# Altium schematic sheet Power_Module.SchDoc
size A; SheetNumber: 1; SheetTotal: 7
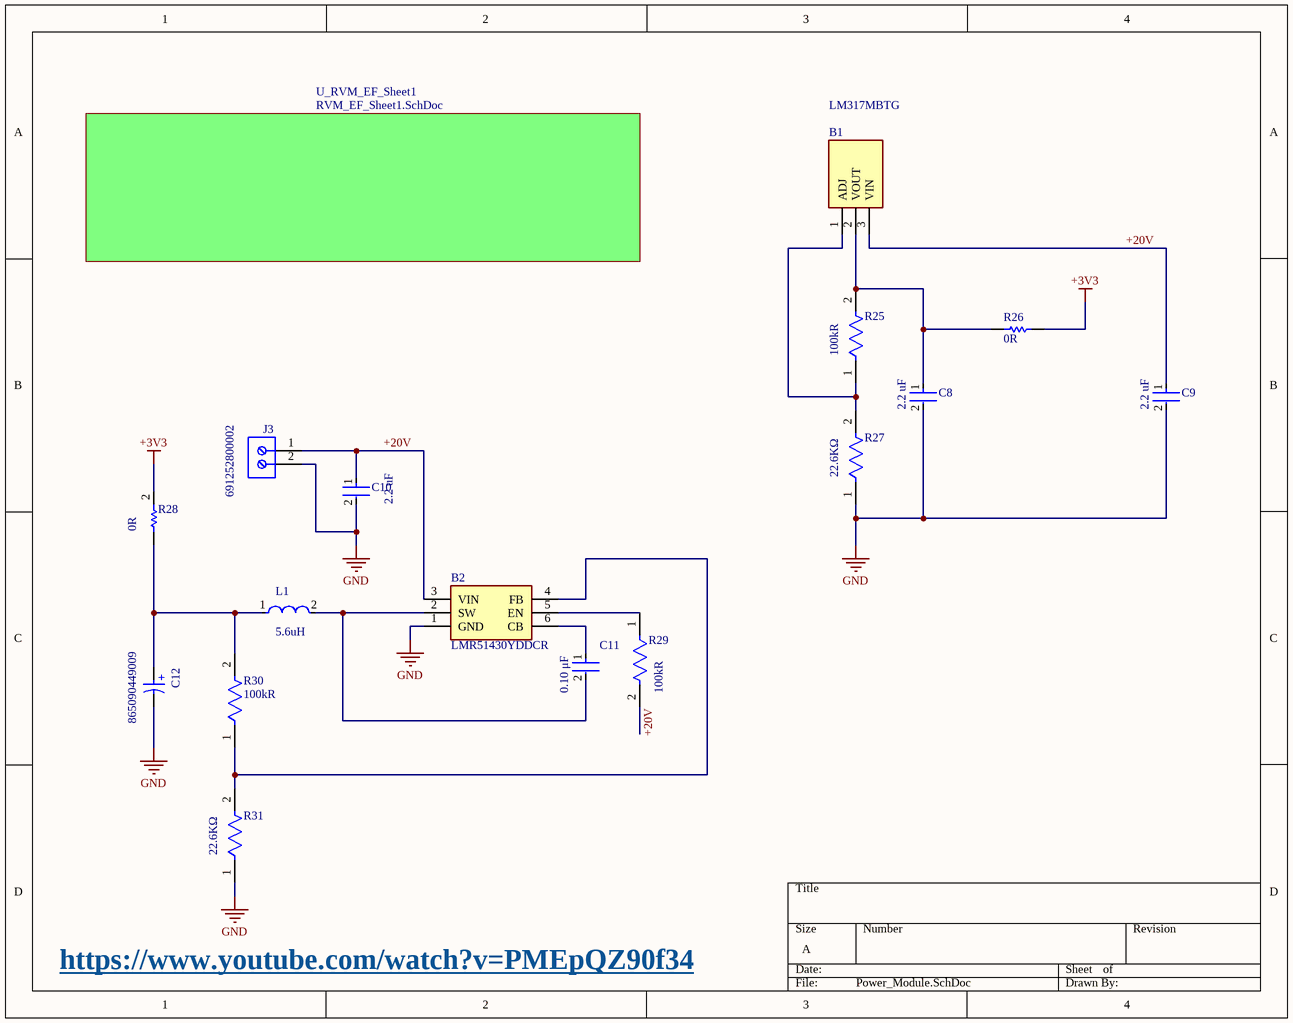
[diagram p0: Power_Module.SchDoc]

## Parts
B1  LM317MBTG  [TO254P482X997X2018-3P]
B2  LMR51430YDDCR  [SOT95P280X110-6N]
C8  value 2.2 uF  [FP-CC0805-0_85-MFG]  (hidden comment: CC0805KKX7R9BB225)
C9  value 2.2 uF  [FP-CC0805-0_85-MFG]  (hidden comment: CC0805KKX7R9BB225)
C10  value 2.2 uF  [FP-CC0805-0_85-MFG]  (hidden comment: CC0805KKX7R9BB225)
C11  value 0.10 μF  [FP-C1206C-EB-MFG]  (hidden comment: C1206C104F3GACTU)
C12  865090449009  [WCAP-ASLU_D8H6.5]
J3  691252800002  [691252800002]
L1  Inductance: 5.6uH  [FP-IHLP-3232CZ-FP_2_413x5-MFG]  (hidden comment: IHLP3232CZER5R6M01)
R25  Resistance: 100kR  [FP-MCU0805-IPC_B]  (hidden comment: MCU08050D1003BP500)
R26  value 0R  [RESC2013X60X35LL10T20]  (hidden comment: RC0805JR-130RL)
R27  value 22.6KΩ  [FP-RT0805-MFG]  (hidden comment: RT0805WRD0722K6L)
R28  value 0R  [RESC2013X60X35LL10T20]  (hidden comment: RC0805JR-130RL)
R29  Resistance: 100kR  [FP-MCU0805-IPC_B]  (hidden comment: MCU08050D1003BP500)
R30  Resistance: 100kR  [FP-MCU0805-IPC_B]  (hidden comment: MCU08050D1003BP500)
R31  value 22.6KΩ  [FP-RT0805-MFG]  (hidden comment: RT0805WRD0722K6L)

## Sub-sheets
U_RVM_EF_Sheet1 = RVM_EF_Sheet1.SchDoc: no entries

## Nets
+3V3: R26.1 R28.2
GND: B2.1(GND) C8.2 C9.2 C10.2 C12.2(N) J3.2 R27.1 R31.1
+20V: B1.3(VIN) B2.3(VIN) C9.1 C10.1 J3.1 R29.2
NetB1_1: B1.1(ADJ) R25.1 R27.2
NetB1_2: B1.2(VOUT) C8.1 R25.2 R26.2
NetB2_2: B2.2(SW) C11.2 L1.2
NetB2_4: B2.4(FB) R30.1 R31.2
NetB2_5: B2.5(EN) R29.1
NetB2_6: B2.6(CB) C11.1
NetC12_1: C12.1(P) L1.1 R28.1 R30.2

## Notes on the sheet
- https://www.youtube.com/watch?v=PMEpQZ90f34
- (in symbol CMP-03913-54202517-2) +

## Library data of the parts
B1 = LM317MBTG: Internal Short Circuit Current Limiting; Internal Thermal Overload Protection; Output Current in Excess of 500 mA; Output Transistor Safe-Area Compensation; Output Adjustable between 1.2 V and 37 V; Floating Operation for High Voltage Applications; Eliminates Stocking Many Fixed Voltages; Pb-Free Packages are Available; NCV Prefix for Automotive and Other Applications Requiring Site Control Changes; Manufacturer_Name: onsemi; Geometry.Height: 4.82mm; Mouser Part Number: 863-LM317MBTG; Mouser Price/Stock: https://www.mouser.co.uk/ProductDetail/onsemi/LM317MBTG?qs=2OtswVQKCOHWWQM%252BNYhxOw%3D%3D; Manufacturer_Part_Number: LM317MBTG; Datasheet Link: https://www.onsemi.com/pub/Collateral/LM317M-D.PDF
B2 = LMR51430YDDCR: Switching Voltage Regulators SIMPLE SWITCHER&reg; 4.5-V to 36-V, 3-A synchronous buck converter with 40-&micro;A IQ; Manufacturer_Name: Texas Instruments; Geometry.Height: 1.1mm; Mouser Part Number: 595-LMR51430YDDCR; Mouser Price/Stock: https://www.mouser.co.uk/ProductDetail/Texas-Instruments/LMR51430YDDCR?qs=vvQtp7zwQdMdLcsY5sFiMg%3D%3D; Manufacturer_Part_Number: LMR51430YDDCR; Datasheet Link: https://www.ti.com/lit/ds/symlink/lmr51430.pdf?ts=1657817980313&ref_url=https%253A%252F%252Fwww.ti.com%252Fproduct%252FLMR51430%253FkeyMatch%253DLMR51430%2526tisearch%253Dsearch-everything%2526usecase%253DGPN
C8-C10 = CMP-03422-001390-1: CAP CER 2.2UF 50V X7R 0805; Manufacturer: Yageo; Tolerance: 0.1; Material: Ceramic; ComponentLink2Description: Datasheet; ComponentLink2URL: http://www.yageo.com/documents/recent/UPY-GPHC_Y5V_6.3V-to-50V_8.pdf; Voltage Rating: 50 V; Device Class L2: Capacitors; Footprint Url: http://www.yageo.com/exep/pages/download/literatures/UPY-C_GEN_24.pdf; Device Class L3: Ceramic Capacitors; Temperature Range High: +85°C; Category: Cap; Lead Free: Yes; Height: 0.95mm; Automotive: No; Temperature Range Low: -30°C; Octopart: https://octopart.com/cc0805kkx7r9bb225-yageo-51849248; Temperature Characteristic: X7R; Ipc Land Pattern Name: CAPC200125X85; Mouser Description: 0805 50 V 2.2 uF ±10% Tolerance X7R Multilayer Ceramic Capacitor; RoHS: TRUE; Temperature: -30°C to +85°C; Capacitance: 2.2 uF; Package: CC0805-0.85; Digikey Description: CAP CER 2.2UF 50V X7R 0805; Manufacturer Part Number: CC0805KKX7R9BB225; Device Class L1: Passive Components
C11 = CMP-1037-04186-2: CAP CER 0.1UF 25V C0G/NP0 1206; Manufacturer: KEMET; Material: Ceramic; Temperature Characteristic: C0G; Temperature Coefficient: 15%; Tolerance: 0.01; Automotive Grade: Grade 0; Device Class L3: Ceramic Capacitors; Voltage Rating: 25 V; Temperature Range Low: -55°C; RoHS: TRUE; Package: C1206C-EB; Category: Cap; Lead Free: Yes; Manufacturer Part Number: C1206C104F3GACTU; ComponentLink2URL: https://content.kemet.com/datasheets/KEM_C1007_X8R_ULTRA_150C_SMD.pdf; Ipc Land Pattern Name: CAPC320160X78; Temperature Range High: +150°C; Height: 0.88mm; Digikey Description: CAP CER 0.1UF 25V C0G/NP0 1206; ComponentLink2Description: Datasheet; Capacitance: 0.10 μF; Mouser Description: Multilayer Ceramic Capacitors MLCC - SMD/SMT 25volts 0.1uF 1% C0G; Octopart: https://octopart.com/c1206c104f3gactu-kemet-13149870; Device Class L1: Passive Components; Device Class L2: Capacitors; Automotive: Yes; Temperature: -55°C to +150°C
C12 = CMP-03913-54202517-2: WCAP-ASLU Aluminum Electrolytic Capacitors; Capacitance: 100µF; Voltage Rating: 25V; Ripple Current: 110mA; Leakage Current: 5µA; Insulation Resistance: 1MΩ; Polarity: Polar; Life (Hours): 1000hours; Tolerance: 20%; Mount: Surface Mount; RoHS: Compliant; Max Operating Temperature: 85°C; Height: 6.5mm; Min Operating Temperature: -40°C; Case/Package: Radial; Length: 6.5mm; Width: 8.3mm; Voltage Rating (DC): 25V; Height - Seated (Max): 6.5024mm; Ripple Current (AC): 110mA; REACH SVHC: Unknown; Diameter: 8mm
J3 = CMP-1502-02796-3: Terminal Block, 10MM Pitch, Vertical, Rising Cage Clamp, 12-30 AWG, 2 Pin
L1 = CMP-02424-000712-1: Commercial Inductors, High Saturation Series 5.6uH 6.3A 37.2mΩ 20%; DC Resistance (DCR): 37.2mR; Test Frequency: 100kHz; Max DC Current: 10A; Shielding: Shielded; Self Resonant Frequency: 21MHz; Core Material: Ferrite; Length: 0.34inch; Package Quantity: 1000; Radiation Hardening: No; Saturation Current: 10A; Depth: 8.26mm; Inductance Tolerance: 20%; Current Rating: 6.3A; Packaging: Tape and Reel; Tolerance: 20%; Series: IHLP-3232CZ-01; Width: 8.18mm; RMS Current (Irms): 6.3A; Mount: Surface Mount; Case/Package: 3232; Termination: SMD/SMT; Rated Current-Max: 6.3A; Height: 3mm; Number of Pins: 2; Max Operating Temperature: 125°C; RoHS Compliant: Yes; Military Standard: Not; Lead Free: Lead Free; Min Operating Temperature: -55°C
R25 R29 R30 = CMP-02407-000489-1: RES 1.05K OHM 0.5% 1/5W 0805; Tolerance: 0.1%; Voltage Rating: 150V; Temperature Coefficient: 25ppm/°C; Power Rating: 125mW; REACH SVHC: No SVHC; Radiation Hardening: No; Composition: Thin Film; Contact Plating: Tin; Lead Free: Lead Free; Max Operating Temperature: 125°C; Width: 1.25mm; Case/Package: 0805; Depth: 1.25mm; Packaging: Tape and Reel; Case Code (Imperial): 0805; Length: 2mm; Case Code (Metric): 2012; Min Operating Temperature: -55°C; Voltage Rating (DC): 150V; Military Standard: Not
R26 R28 = CMP-2001-01414-1: Manufacturer: Yageo; Part Number: RC0805JR-130RL
R27 R31 = CMP-03412-025351-1: RES SMD 22.6KOHM 0.05% 1/8W 0805; Manufacturer: Yageo; Power Rating: 0.125W; Voltage Rating: 150V; Temperature Coefficient: 25 ppm/°C; Tolerance: 0.001; Footprint Url: http://www.yageo.com/exep/pages/download/literatures/PYu-R_Mount_10.pdf; Package: RT0805; Device Class L3: Chip SMD Resistors; Height: 0.6mm; Temperature Range High: +155°C; ComponentLink2Description: Datasheet; Manufacturer Part Number: RT0805WRD0722K6L; Temperature Range Low: -55°C; Temperature: -55°C to +155°C; Lead Free: Yes; Resistance: 22.6KΩ; Automotive: No; Series: RT; Digikey Description: RES SMD 22.6KOHM 0.05% 1/8W 0805; Octopart: https://octopart.com/rt0805wrd0722k6l-yageo-71401359; Category: Res; ComponentLink2URL: http://www.yageo.com/documents/recent/PYu-RT_1-to-0.01_RoHS_L_9.pdf; Ipc Land Pattern Name: RESC200125X50; Composition: Thin Film; Device Class L2: Resistors; Device Class L1: Passive Components; RoHS: TRUE